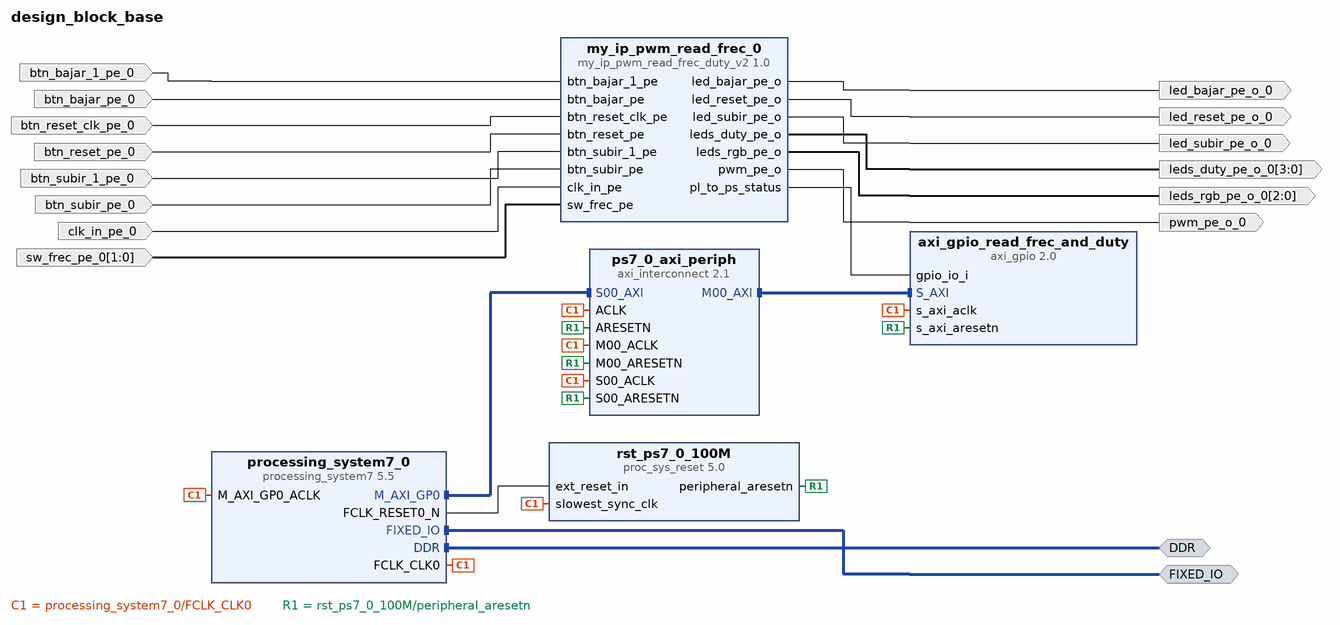
[diagram p0: block diagram of the top level]
# Vivado block design design_block_base, xc7z010clg400-1, Vivado 2018.3
create_bd_design design_block_base

create_bd_intf_port -mode Master -vlnv xilinx.com:interface:ddrx_rtl:1.0 DDR
create_bd_intf_port -mode Master -vlnv xilinx.com:display_processing_system7:fixedio_rtl:1.0 FIXED_IO
create_bd_port -dir I btn_bajar_1_pe_0
create_bd_port -dir I btn_bajar_pe_0
create_bd_port -dir I btn_reset_clk_pe_0
create_bd_port -dir I btn_reset_pe_0
create_bd_port -dir I btn_subir_1_pe_0
create_bd_port -dir I btn_subir_pe_0
create_bd_port -dir I clk_in_pe_0
create_bd_port -dir O led_bajar_pe_o_0
create_bd_port -dir O led_reset_pe_o_0
create_bd_port -dir O led_subir_pe_o_0
create_bd_port -dir O -from 3 -to 0 leds_duty_pe_o_0
create_bd_port -dir O -from 2 -to 0 leds_rgb_pe_o_0
create_bd_port -dir O pwm_pe_o_0
create_bd_port -dir I -from 1 -to 0 sw_frec_pe_0

create_bd_cell -type ip -vlnv xilinx.com:ip:processing_system7:5.5 processing_system7_0
set_property -dict [list \
  CONFIG.PCW_APU_PERIPHERAL_FREQMHZ 650 \
  CONFIG.PCW_CRYSTAL_PERIPHERAL_FREQMHZ 50 \
  CONFIG.PCW_ENET0_PERIPHERAL_ENABLE 0 \
  CONFIG.PCW_FCLK_CLK0_BUF FALSE \
  CONFIG.PCW_FPGA0_PERIPHERAL_FREQMHZ 100 \
  CONFIG.PCW_FPGA1_PERIPHERAL_FREQMHZ 50 \
  CONFIG.PCW_GPIO_MIO_GPIO_ENABLE 0 \
  CONFIG.PCW_M_AXI_GP0_FREQMHZ 10 \
  CONFIG.PCW_PERIPHERAL_BOARD_PRESET part0 \
  CONFIG.PCW_PRESET_BANK1_VOLTAGE {LVCMOS 1.8V} \
  CONFIG.PCW_QSPI_PERIPHERAL_ENABLE 0 \
  CONFIG.PCW_SD0_PERIPHERAL_ENABLE 0 \
  CONFIG.PCW_UART0_PERIPHERAL_ENABLE 1 \
  CONFIG.PCW_UART0_UART0_IO {MIO 14 .. 15} \
  CONFIG.PCW_UART1_PERIPHERAL_ENABLE 0 \
  CONFIG.PCW_UART_PERIPHERAL_FREQMHZ 100 \
  CONFIG.PCW_UIPARAM_DDR_BUS_WIDTH {16 Bit} \
  CONFIG.PCW_UIPARAM_DDR_FREQ_MHZ 525 \
  CONFIG.PCW_UIPARAM_DDR_PARTNO {MT41J256M16 RE-125} \
  CONFIG.PCW_USB0_PERIPHERAL_ENABLE 0 \
] [get_bd_cells processing_system7_0]
# 325 more settings of processing_system7_0 are not shown: defaults, MIO pin electricals, DDR timing, and values the tool derives
create_bd_cell -type ip -vlnv xilinx.com:ip:axi_gpio:2.0 axi_gpio_read_frec_and_duty
set_property -dict [list \
  CONFIG.C_ALL_INPUTS 1 \
  CONFIG.C_GPIO_WIDTH 32 \
  CONFIG.GPIO_BOARD_INTERFACE Custom \
  CONFIG.USE_BOARD_FLOW true \
] [get_bd_cells axi_gpio_read_frec_and_duty]
create_bd_cell -type ip -vlnv xilinx.com:user:my_ip_pwm_read_frec_duty_v2:1.0 my_ip_pwm_read_frec_0
create_bd_cell -type ip -vlnv xilinx.com:ip:axi_interconnect:2.1 ps7_0_axi_periph
set_property -dict {CONFIG.NUM_MI 1} [get_bd_cells ps7_0_axi_periph]
create_bd_cell -type ip -vlnv xilinx.com:ip:proc_sys_reset:5.0 rst_ps7_0_100M

# ---- connections ----

connect_bd_intf_net [get_bd_intf_ports FIXED_IO] [get_bd_intf_pins processing_system7_0/FIXED_IO]
connect_bd_intf_net [get_bd_intf_pins ps7_0_axi_periph/M00_AXI] [get_bd_intf_pins axi_gpio_read_frec_and_duty/S_AXI]
connect_bd_intf_net [get_bd_intf_ports DDR] [get_bd_intf_pins processing_system7_0/DDR]
connect_bd_intf_net [get_bd_intf_pins processing_system7_0/M_AXI_GP0] [get_bd_intf_pins ps7_0_axi_periph/S00_AXI]
connect_bd_net [get_bd_pins my_ip_pwm_read_frec_0/pl_to_ps_status] [get_bd_pins axi_gpio_read_frec_and_duty/gpio_io_i]
connect_bd_net [get_bd_pins processing_system7_0/FCLK_CLK0] \
  [get_bd_pins processing_system7_0/M_AXI_GP0_ACLK] [get_bd_pins ps7_0_axi_periph/S00_ACLK] \
  [get_bd_pins rst_ps7_0_100M/slowest_sync_clk] [get_bd_pins axi_gpio_read_frec_and_duty/s_axi_aclk] \
  [get_bd_pins ps7_0_axi_periph/M00_ACLK] [get_bd_pins ps7_0_axi_periph/ACLK]
connect_bd_net [get_bd_pins processing_system7_0/FCLK_RESET0_N] [get_bd_pins rst_ps7_0_100M/ext_reset_in]
connect_bd_net [get_bd_pins rst_ps7_0_100M/peripheral_aresetn] \
  [get_bd_pins ps7_0_axi_periph/S00_ARESETN] [get_bd_pins axi_gpio_read_frec_and_duty/s_axi_aresetn] \
  [get_bd_pins ps7_0_axi_periph/M00_ARESETN] [get_bd_pins ps7_0_axi_periph/ARESETN]
connect_bd_net -net btn_bajar_1_pe_0_1 [get_bd_ports btn_bajar_1_pe_0] [get_bd_pins my_ip_pwm_read_frec_0/btn_bajar_1_pe]
connect_bd_net -net btn_bajar_pe_0_1 [get_bd_ports btn_bajar_pe_0] [get_bd_pins my_ip_pwm_read_frec_0/btn_bajar_pe]
connect_bd_net -net btn_reset_clk_pe_0_1 [get_bd_ports btn_reset_clk_pe_0] [get_bd_pins my_ip_pwm_read_frec_0/btn_reset_clk_pe]
connect_bd_net -net btn_reset_pe_0_1 [get_bd_ports btn_reset_pe_0] [get_bd_pins my_ip_pwm_read_frec_0/btn_reset_pe]
connect_bd_net -net btn_subir_1_pe_0_1 [get_bd_ports btn_subir_1_pe_0] [get_bd_pins my_ip_pwm_read_frec_0/btn_subir_1_pe]
connect_bd_net -net btn_subir_pe_0_1 [get_bd_ports btn_subir_pe_0] [get_bd_pins my_ip_pwm_read_frec_0/btn_subir_pe]
connect_bd_net -net clk_in_pe_0_1 [get_bd_ports clk_in_pe_0] [get_bd_pins my_ip_pwm_read_frec_0/clk_in_pe]
connect_bd_net [get_bd_pins my_ip_pwm_read_frec_0/led_bajar_pe_o] [get_bd_ports led_bajar_pe_o_0]
connect_bd_net [get_bd_pins my_ip_pwm_read_frec_0/led_reset_pe_o] [get_bd_ports led_reset_pe_o_0]
connect_bd_net [get_bd_pins my_ip_pwm_read_frec_0/led_subir_pe_o] [get_bd_ports led_subir_pe_o_0]
connect_bd_net [get_bd_pins my_ip_pwm_read_frec_0/leds_duty_pe_o] [get_bd_ports leds_duty_pe_o_0]
connect_bd_net [get_bd_pins my_ip_pwm_read_frec_0/leds_rgb_pe_o] [get_bd_ports leds_rgb_pe_o_0]
connect_bd_net [get_bd_pins my_ip_pwm_read_frec_0/pwm_pe_o] [get_bd_ports pwm_pe_o_0]
connect_bd_net -net sw_frec_pe_0_1 [get_bd_ports sw_frec_pe_0] [get_bd_pins my_ip_pwm_read_frec_0/sw_frec_pe]

# ---- address map ----
assign_bd_address -offset 0x41200000 -range 64K -target_address_space [get_bd_addr_spaces processing_system7_0/Data] [get_bd_addr_segs axi_gpio_read_frec_and_duty/S_AXI/Reg]

validate_bd_design
save_bd_design
